# Altium schematic sheet Bias_Power_Supply.SchDoc
size A4; SheetNumber: 3; SheetTotal: 7
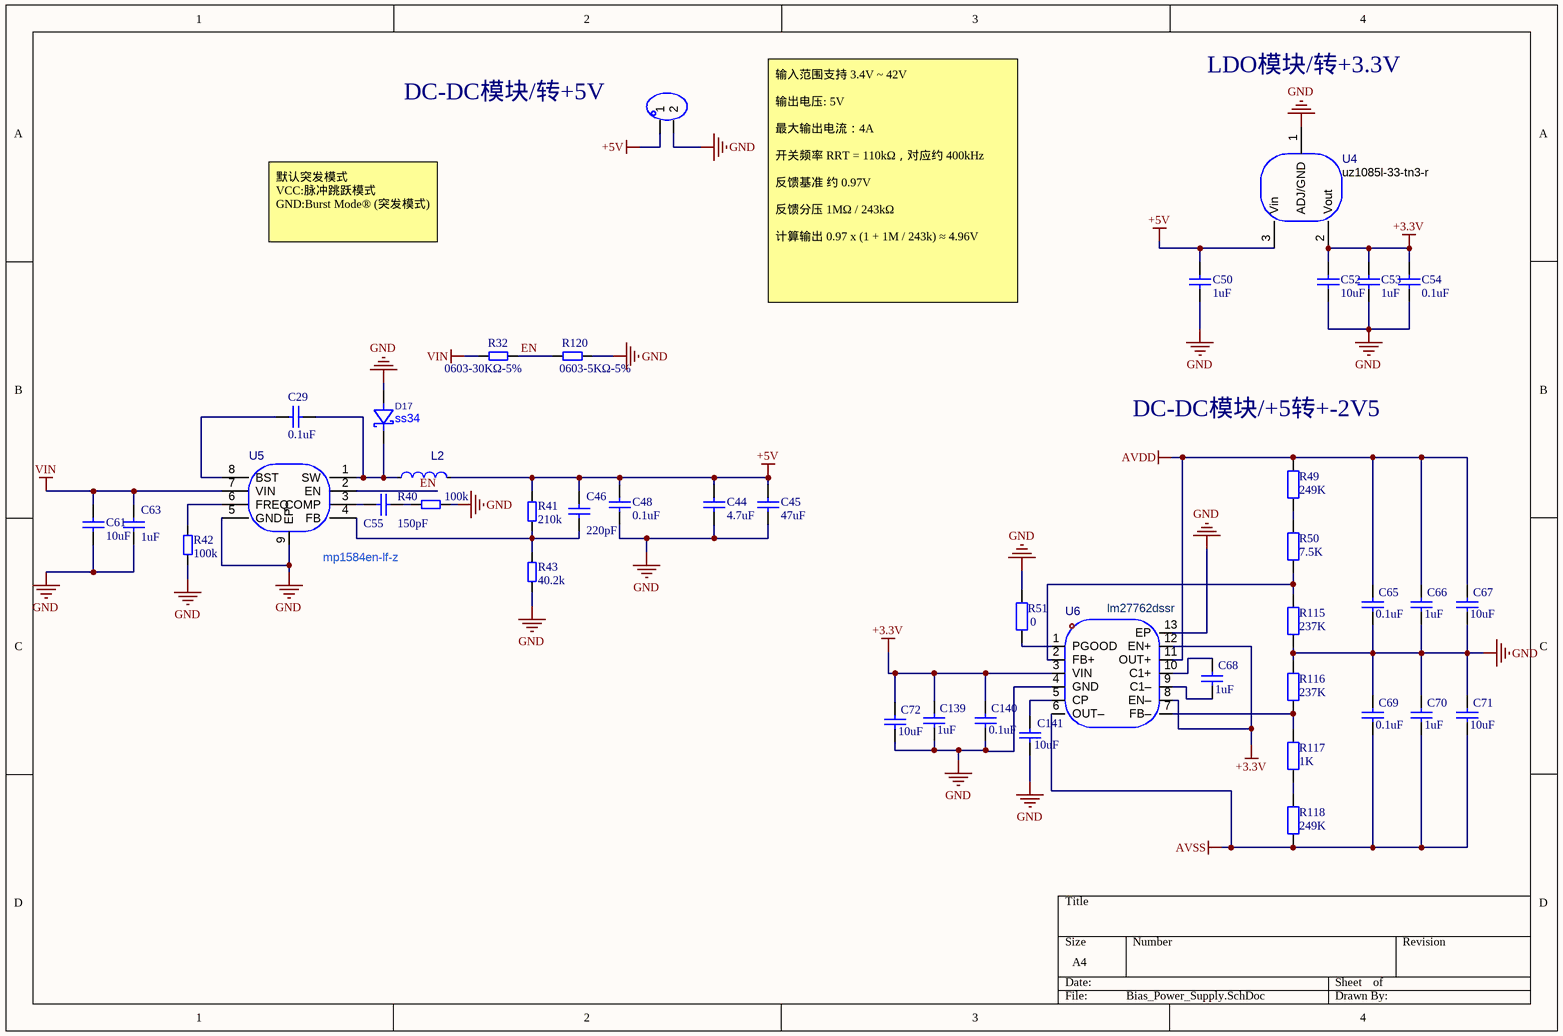
[diagram p0: Bias_Power_Supply.SchDoc]

## Parts
C29  0.1uF  [C0603]
C44  4.7uF  [C0805]
C45  47uF  [C0805]
C46  220pF  [C0603]
C48  0.1uF  [C0603]
C50  1uF  [C0603]
C52  10uF  [C0603]
C53  1uF  [C0603]
C54  0.1uF  [C0603]
C55  150pF  [C0603]
C61  10uF  [C0805]
C63  1uF  [C0603]
C65  0.1uF  [C0603]
C66  1uF  [C0603]
C67  10uF  [C0603]
C68  1uF  [C0603]
C69  0.1uF  [C0603]
C70  1uF  [C0603]
C71  10uF  [C0603]
C72  10uF  [C0603]
C139  1uF  [C0603]
C140  0.1uF  [C0603]
C141  10uF  [C0603]
D17  ss34  [SMA_L4.3-W2.6-LS5.0-FD]
H7  pz254v-11-02p  [HDR-TH_2P-P2.54-V-M]  (value not drawn)
L2  fxl0630-100-m  [IND-SMD_L7.3-W6.8]  (value not drawn)
R32  0603-30KΩ-5%  [R0603]
R40  100k  [R0603]
R41  210k  [R0603]
R42  100k  [R0603]
R43  40.2k  [R0603]
R49  249K  [R0603]
R50  7.5K  [R0603]
R51  0  [R0603]
R115  237K  [R0603]
R116  237K  [R0603]
R117  1K  [R0603]
R118  249K  [R0603]
R120  0603-5KΩ-5%  [R0603]
U4  uz1085l-33-tn3-r  [TO-252-2_L6.6-W6.1-P4.58-TL]
U5  mp1584en-lf-z  [SOIC-8_L5.0-W4.0-P1.27-LS6.0-BL-EP2.0]
U6  lm27762dssr  [WSON-12_L3.0-W2.0-P0.50-BL-EP]

## Nets
+3.3V: C52.2 C53.2 C54.2 C72.2 C139.2 C140.2 U4.2(Vout) U6.3(VIN) U6.8(EN–) U6.12(EN+)
+5V: C44.2 C45.2 C46.1 C48.2 C50.2 H7.1 L2.2 R41.1 U4.3(Vin)
AVDD: C65.2 C66.2 C67.2 R49.2 U6.11(OUT+)
AVSS: C69.1 C70.1 C71.1 R118.1 U6.6(OUT–)
GND: C44.1 C45.1 C48.1 C50.1 C52.1 C53.1 C54.1 C61.1 C63.1 C65.1 C66.1 C67.1 C69.2 C70.2 C71.2 C72.1 C139.1 C140.1 C141.1 D17.1(A) H7.2 R40.2 R42.1 R43.2 R51.2 R115.1 R116.2 R120.2 U4.1(ADJ/GND) U5.5(GND) U5.9(EP) U6.4(GND) U6.13(EP)
VIN: C61.2 C63.2 R32.1 U5.7(VIN)
EN: R32.2 R120.1 U5.2(EN)
NetC29_1: C29.1 D17.2(K) L2.1 U5.1(SW)
NetC29_2: C29.2 U5.8(BST)
NetC46_2: C46.2 R41.2 R43.1 U5.4(FB)
NetC55_1: C55.1 R40.1
NetC55_2: C55.2 U5.3(COMP)
NetC68_1: C68.1 U6.9(C1–)
NetC68_2: C68.2 U6.10(C1+)
NetC141_2: C141.2 U6.5(CP)
NetR42_2: R42.2 U5.6(FREQ)
NetR49_1: R49.1 R50.2
NetR50_1: R50.1 R115.2 U6.2(FB+)
NetR51_1: R51.1 U6.1(PGOOD)
NetR116_1: R116.1 R117.2 U6.7(FB–)
NetR117_1: R117.1 R118.2

## Notes on the sheet
- DC-DC模块/转+5V
- LDO模块/转+3.3V
- 默认突发模式
  VCC:脉冲跳跃模式
  GND:Burst Mode® (突发模式)
- 输入范围支持 3.4V ~ 42V
  输出电压: 5V
  最大输出电流：4A
  开关频率	RRT = 110kΩ，对应约 400kHz
  反馈基准	约 0.97V
  反馈分压	1MΩ / 243kΩ
  计算输出	0.97 x (1 + 1M / 243k) ≈ 4.96V
- (near R49) DC-DC模块/+5转+-2V5

## Library data of the parts
C29 C46 C48 C50 C52-C55 C63 = C0603: Capacitor; Value: 104; Published: 8-Jun-2000; LatestRevisionDate: 17-Jul-2002; LatestRevisionNote: Re-released for DXP Platform.; Publisher: Altium Limited
C44 C45 C61 = C0805: Capacitor; Value: 104; Published: 8-Jun-2000; LatestRevisionDate: 17-Jul-2002; LatestRevisionNote: Re-released for DXP Platform.; Publisher: Altium Limited
C65 C69 C140 = C0603: CAP CER 0.1UF 25V, 10% X7R 0603; Value: 104; Published: 8-Jun-2000; LatestRevisionDate: 17-Jul-2002; LatestRevisionNote: Re-released for DXP Platform.; Publisher: Altium Limited
C66 C68 C70 C139 = C0603: CAP CER 1UF 25V, 10% X7R 0603; Value: 104; Published: 8-Jun-2000; LatestRevisionDate: 17-Jul-2002; LatestRevisionNote: Re-released for DXP Platform.; Publisher: Altium Limited
C67 C71 C72 C141 = C0603: CAP CER 10UF 25V, 10% X7R 0603; Value: 104; Published: 8-Jun-2000; LatestRevisionDate: 17-Jul-2002; LatestRevisionNote: Re-released for DXP Platform.; Publisher: Altium Limited
D17 = ss34_c7420365: 二极管配置:独立式;正向压降(Vf):550mV@3A;直流反向耐压(Vr):40V;整流电流:3A;; Manufacturer: R+O(宏嘉诚); AddInBom: yes; ModelId: 7e24bebe6cd74171ae8c9de6fc5b78aa; ModelTransform: 198.4248,103.5431,0,180,0,0,-0.001,0,0; Diode Configuration: 独立式; Voltage - DC Reverse(Vr): 40V; Current - Rectified: 3A; Reverse Leakage Current (Ir): 200uA@40V; Symbol: SS34_C7420365; LCSC Part Name: 电压:40V 电流:3A; SupplierPart: C7420365; ManufacturerPart: SS34; Supplier Footprint: SMA(DO-214AC); JLCPCB Part Class: Extended Part; Datasheet: https://item.szlcsc.com/datasheet/SS34/8397187.html; Supplier: LCSC; ConvertToPcb: yes; FootprintName: SMA_L4.3-W2.6-LS5.0-FD; ModelName: SMA_L4.3-W2.6-LS5.0-FD; Voltage - Forward(Vf@If): 550mV@3A
H7 = pz254v-11-02p: 插针结构:1x2P;间距:2.54mm;行距:-;圆针/方针:方针;安装方式:直插;排数:单排;总PIN位数:2P;额定电流:3A;额定电压:250V;配合针长度:6mm;塑高:2.5mm;端接针长度:3mm;触头材质:黄铜;触头镀层:-;工作温度:-40℃~+105℃;颜色:黑色;; Manufacturer: XFCN(兴飞); AddInBom: yes; ModelId: e35305ec3aa84b66b849f914b715e73f; ModelName: HDR2.54-M-LI-1X2P; ModelTransform: 200,100,0,0,0,0,0,0,-118.11; Pin Structure: 1x2P; Pitch: 2.54mm; Circluar Pins/Square Pins: 方针; Current Rating: 3A; Voltage Rating (Max): 250V; Symbol: PZ254V-11-02P; LCSC Part Name: 1x2P 间距:2.54mm 方针 直插; SupplierPart: C492401; ManufacturerPart: PZ254V-11-02P; Supplier Footprint: 插件,P=2.54mm; JLCPCB Part Class: Extended Part; Datasheet: https://item.szlcsc.com/datasheet/PZ254V-11-02P/502957.html; Supplier: LCSC; ConvertToPcb: yes; FootprintName: HDR-TH_2P-P2.54-V-M; Row Spacing: -; Mounting Type: 直插; Number of Rows: 单排; Number of Pins: 2P; Length of Mating Pin: 6mm; Insulation Height: 2.5mm; Length of End Connection Pin: 3mm; Contact Material: 黄铜; Contact Plating: -; Operating Temperature: -40℃~+105℃; Color: 黑色
L2 = fxl0630-100-m: 电感值:10uH;精度:±20%;额定电流:4.5A;饱和电流(Isat):5.5A;类型:一体成型电感;; Manufacturer: cjiang(长江微电); AddInBom: yes; ModelId: e28854526ca747668ea12fbe1dd39a63; ModelName: IND-SMD_L7.3-W6.8-H3.0; ModelTransform: 292.125,267.716,0,0,0,0,0,0,0; Value: 10uH; Tolerance: ±20%; Current Rating: 4.5A; Current - Saturation(Isat): 5.5A; DC Resistance(DCR): 68mΩ; Type: 一体成型电感; Symbol: FXL0630-100-M; LCSC Part Name: 10uH ±20% 5.5A; SupplierPart: C167223; ManufacturerPart: FXL0630-100-M; Supplier Footprint: SMD,7x6.6mm; JLCPCB Part Class: Extended Part; Datasheet: https://item.szlcsc.com/datasheet/FXL0630-100-M/178606.html; Supplier: LCSC; ConvertToPcb: yes; FootprintName: IND-SMD_L7.3-W6.8; Ratings: -
R32 R120 = 0603-1KΩ-5%: 片式电阻; 物料描述: 片式电阻器-0805-10KΩ-5%-JT; 物料号: NA
R40-R43 = 0603-3KΩ-5%: 片式电阻; 物料描述: 片式电阻器-0805-10KΩ-5%-JT; 物料号: NA
R49 R118 = R0603: 薄膜电阻 249kΩ ±0.1% 100mW; Published: 8-Jun-2000; LatestRevisionDate: 17-Jul-2002; LatestRevisionNote: Re-released for DXP Platform.; Publisher: Altium Limited
R50 R51 R115 R116 = R0603: Resistor; Published: 8-Jun-2000; LatestRevisionDate: 17-Jul-2002; LatestRevisionNote: Re-released for DXP Platform.; Publisher: Altium Limited
R117 = R0603: 厚膜电阻 1kΩ ±1% 100mW; Published: 8-Jun-2000; LatestRevisionDate: 17-Jul-2002; LatestRevisionNote: Re-released for DXP Platform.; Publisher: Altium Limited
U4 = uz1085l-33-tn3-r: 输出极性:正极;工作电压:18V;输出电压:3.3V;输出电流:3A;电源纹波抑制比(PSRR):72dB@(120Hz);输出类型:固定;; Manufacturer: UTC(友顺); AddInBom: yes; ModelId: ce57f84d66384067af8a68020b6de06d; ModelName: TO-252-2L-3P_L6.6-W6.1-H2.3-LS10.1-P4.6; ModelTransform: 259.842,390.52442,0,270,0,0,31.494,-0.12,0; Output Configuration: 正极; Voltage - Supply: 18V; Output Voltage: 3.3V; Output Current: 3A; Voltage Dropout: 1.4V@(3A); standby current: 4mA; Noise: 0.003%Vout; Output Type: 固定; Number of Outputs: 1; Symbol: UZ1085L-33-TN3-R; LCSC Part Name: 3.3V 3A 18V; SupplierPart: C125622; ManufacturerPart: UZ1085L-33-TN3-R; Supplier Footprint: TO-252-2(DPAK); JLCPCB Part Class: Extended Part; Datasheet: https://item.szlcsc.com/datasheet/UZ1085L-33-TN3-R/136900.html; Supplier: LCSC; ConvertToPcb: yes; FootprintName: TO-252-2_L6.6-W6.1-P4.58-TL; Power Supply Rejection Ratio (PSRR): 72dB@(120Hz); Features: 过流保护；热关断; Operating Temperature: -40℃~+85℃
U5 = mp1584en-lf-z: 功能类型:降压型;工作电压:4.5V~28V;输出电压:800mV~25V;输出电流:3A;输出类型:可调;; Manufacturer: MPS(芯源); AddInBom: yes; ModelId: d3dfb165ce8644e793b750cd6f375e75; ModelTransform: 192.913,236.22,0,0,0,0,0,0,0; Function: 降压型; Output Current: 3A; Frequency - Switching: 100kHz~1.5MHz; Synchronous Rectifier: 否; Number of Outputs: 1; Topology: 降压式; Quiescent Current: 100uA; Switch tube (built-in/external): 内置; Output Type: 可调; Symbol: MP1584EN-LF-Z; LCSC Part Name: 降压型 3A 4.5V~28V; SupplierPart: C15051; ManufacturerPart: MP1584EN-LF-Z; Supplier Footprint: SOIC-8-EP; JLCPCB Part Class: Extended Part; Datasheet: https://item.szlcsc.com/datasheet/MP1584EN-LF-Z/15724.html; Supplier: LCSC; ConvertToPcb: yes; FootprintName: SOIC-8_L5.0-W4.0-P1.27-LS6.0-BL-EP2.0; ModelName: SOIC-8_L5.0-W4.0-P1.27-LS6.0-BL-EP2.0; Voltage - Supply: 4.5V~28V; Output Voltage: 800mV~25V; Operating Temperature: -20℃~+85℃@(TA); Features: 轻载高效模式；外部补偿；过流保护
U6 = lm27762dssr: LM27762 带有集成 LDO 的低噪声正负输出电荷泵; Manufacturer: TI(德州仪器); AddInBom: yes; ModelId: 75df7d26feb145b0ac5ce3287ea6d356; ModelName: WSON-12_L3.0-W2.0-H0.8-P0.50; ModelTransform: 79.527,118.8974,0,90,0,0,0,0,0; Function: 反相; Operating Voltage: 2.7V~5.5V; Output Voltage: -5V~-1.5V；1.5V~5V; Output Current: 250mA; Quiescent Current: 390uA; Output Resistance: 2.5Ω; Switching Frequency: 2MHz; PFM Mode: 支持; Symbol: LM27762DSSR; LCSC Part Name: 低噪声正负输出集成电荷泵加LDO; SupplierPart: C473398; ManufacturerPart: LM27762DSSR; Supplier Footprint: WSON-12-EP(2x3); JLCPCB Part Class: Extended Part; Datasheet: https://www.ti.com/cn/lit/ds/symlink/lm27762.pdf; Supplier: LCSC; ConvertToPcb: yes; FootprintName: WSON-12_L3.0-W2.0-P0.50-BL-EP; Energy Efficiency: -; Operating Temperature: -40℃~+85℃; Features: 自适应开关频率；过流保护；低纹波/低噪声架构；输出短路保护；低功耗待机